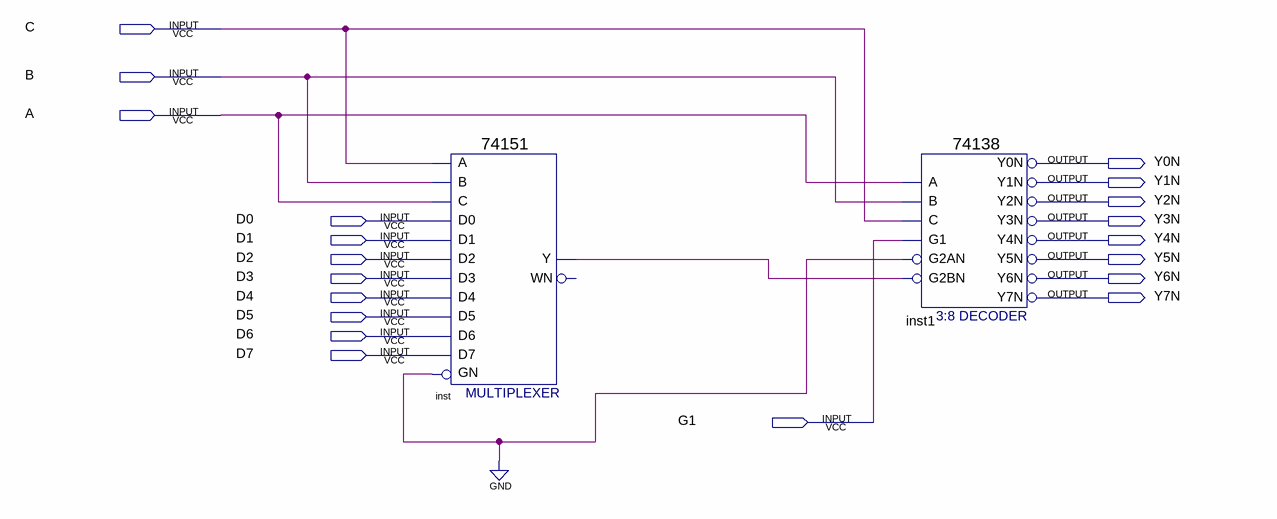
[diagram p0: schematic sheet]
// Quartus schematic eight.bdf as structural Verilog: 2 symbols, 20 pins
module eight (
  input  C,
  input  B,
  input  A,
  input  D0,
  input  D1,
  input  D2,
  input  D3,
  input  D4,
  input  D5,
  input  D6,
  input  D7,
  input  G1,
  output Y0N,
  output Y1N,
  output Y2N,
  output Y3N,
  output Y4N,
  output Y5N,
  output Y6N,
  output Y7N
);

  wire inst_y;

  \74151  inst (
    .GN(1'b0), .C(A), .B(B), .A(C), .D5(D5), .D0(D0), .D1(D1), .D4(D4), .D3(D3), .D2(D2), .D6(D6), .D7(D7),
    .Y(inst_y));  // open: WN
  \74138  inst1 (
    .A(A), .B(B), .G1(G1), .C(C), .G2AN(1'b0), .G2BN(inst_y), .Y0N(Y0N), .Y1N(Y1N), .Y2N(Y2N), .Y3N(Y3N),
    .Y4N(Y4N), .Y5N(Y5N), .Y6N(Y6N), .Y7N(Y7N));
endmodule
